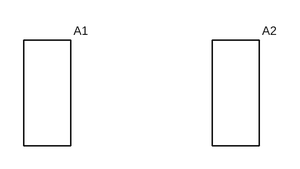
[diagram p0: schematic adevice_stacked_pins.asc]
adevice_stacked_pins.asc, the LTspice schematic file:
Version 4
SHEET 1 880 680
WIRE 320 96 320 112
SYMBOL a8_stacked 96 64 R0
SYMATTR InstName A1
SYMBOL a8 352 64 R0
SYMATTR InstName A2

The netlist it stands for:
* adevice_stacked_pins.asc
A1 0 0 P001 P001 0 0 0 0 AND
A2 0 0 N001 N001 0 0 0 0 AND
.backanno
.end